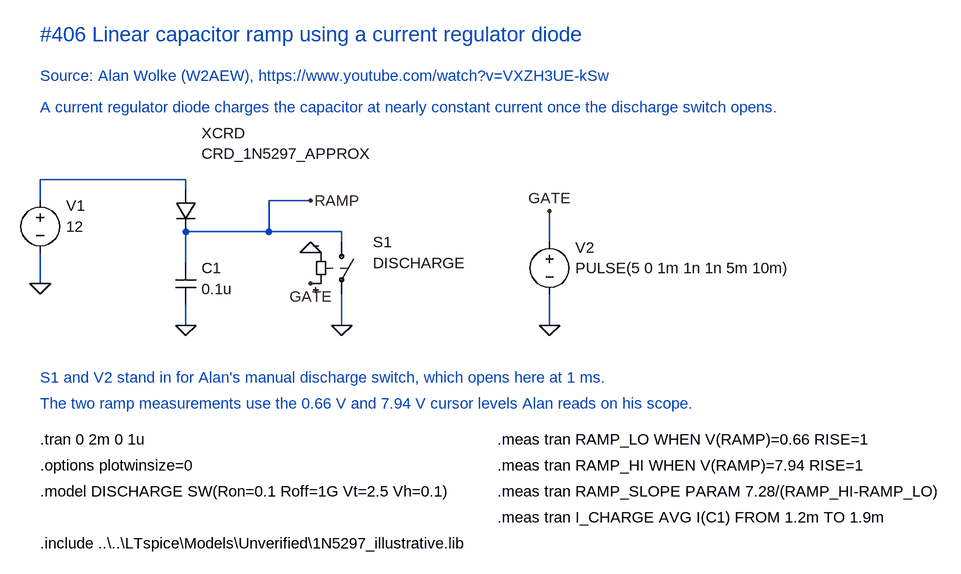
[diagram p0: schematic Linear capacitor ramp.asc]
Linear capacitor ramp.asc, the LTspice schematic file:
Version 4.1
SHEET 1 1600 1000
WIRE 96 272 96 304
WIRE 320 272 96 272
WIRE 320 288 320 272
WIRE 320 400 320 352
WIRE 448 352 320 352
WIRE 560 352 448 352
WIRE 560 368 560 352
WIRE 448 304 448 352
WIRE 512 304 448 304
WIRE 96 432 96 384
WIRE 320 496 320 464
WIRE 560 496 560 448
WIRE 880 320 880 368
WIRE 880 496 880 448
FLAG 96 432 0
FLAG 320 496 0
FLAG 560 496 0
FLAG 880 496 0
FLAG 512 304 RAMP
FLAG 512 432 GATE
FLAG 512 384 0
FLAG 880 320 GATE
SYMBOL voltage 96 288 R0
WINDOW 0 40 24 Left 2
WINDOW 3 40 56 Left 2
SYMATTR InstName V1
SYMATTR Value 12
SYMBOL diode 304 288 R0
WINDOW 0 40 -88 Left 2
WINDOW 3 40 -56 Left 2
SYMATTR Prefix X
SYMATTR InstName XCRD
SYMATTR Value CRD_1N5297_APPROX
SYMBOL cap 304 400 R0
WINDOW 0 40 8 Left 2
WINDOW 3 40 40 Left 2
SYMATTR InstName C1
SYMATTR Value 0.1u
SYMBOL sw 560 352 R0
WINDOW 0 48 16 Left 2
WINDOW 3 48 48 Left 2
SYMATTR InstName S1
SYMATTR Value DISCHARGE
SYMBOL voltage 880 352 R0
WINDOW 0 40 24 Left 2
WINDOW 3 40 56 Left 2
SYMATTR InstName V2
SYMATTR Value PULSE(5 0 1m 1n 1n 5m 10m)
TEXT 96 48 Left 3 ;#406 Linear capacitor ramp using a current regulator diode
TEXT 96 112 Left 2 ;Source: Alan Wolke (W2AEW), https://www.youtube.com/watch?v=VXZH3UE-kSw
TEXT 96 160 Left 2 ;A current regulator diode charges the capacitor at nearly constant current once the discharge switch opens.
TEXT 96 576 Left 2 ;S1 and V2 stand in for Alan's manual discharge switch, which opens here at 1 ms.
TEXT 96 616 Left 2 ;The two ramp measurements use the 0.66 V and 7.94 V cursor levels Alan reads on his scope.
TEXT 96 672 Left 2 !.tran 0 2m 0 1u
TEXT 96 712 Left 2 !.options plotwinsize=0
TEXT 96 752 Left 2 !.model DISCHARGE SW(Ron=0.1 Roff=1G Vt=2.5 Vh=0.1)
TEXT 96 832 Left 2 !.include ..\..\LTspice\Models\Unverified\1N5297_illustrative.lib
TEXT 800 672 Left 2 !.meas tran RAMP_LO WHEN V(RAMP)=0.66 RISE=1
TEXT 800 712 Left 2 !.meas tran RAMP_HI WHEN V(RAMP)=7.94 RISE=1
TEXT 800 752 Left 2 !.meas tran RAMP_SLOPE PARAM 7.28/(RAMP_HI-RAMP_LO)
TEXT 800 792 Left 2 !.meas tran I_CHARGE AVG I(C1) FROM 1.2m TO 1.9m

The netlist it stands for:
* Linear capacitor ramp.asc
V1 N001 0 12
X§XCRD N001 RAMP CRD_1N5297_APPROX  ; pins + -
C1 RAMP 0 0.1u
S1 RAMP 0 GATE 0 DISCHARGE
V2 GATE 0 PULSE(5 0 1m 1n 1n 5m 10m)
* #406 Linear capacitor ramp using a current regulator diode
* Source: Alan Wolke (W2AEW), https://www.youtube.com/watch?v=VXZH3UE-kSw
* A current regulator diode charges the capacitor at nearly constant current once the discharge switch opens.
* S1 and V2 stand in for Alan's manual discharge switch, which opens here at 1 ms.
* The two ramp measurements use the 0.66 V and 7.94 V cursor levels Alan reads on his scope.
.tran 0 2m 0 1u
.options plotwinsize=0
.model DISCHARGE SW(Ron=0.1 Roff=1G Vt=2.5 Vh=0.1)
.include ..\..\LTspice\Models\Unverified\1N5297_illustrative.lib
.meas tran RAMP_LO WHEN V(RAMP)=0.66 RISE=1
.meas tran RAMP_HI WHEN V(RAMP)=7.94 RISE=1
.meas tran RAMP_SLOPE PARAM 7.28/(RAMP_HI-RAMP_LO)
.meas tran I_CHARGE AVG I(C1) FROM 1.2m TO 1.9m
.backanno
.end